# Altium schematic sheet 7V Buck.SchDoc
size B; SheetNumber: 2; SheetTotal: 9
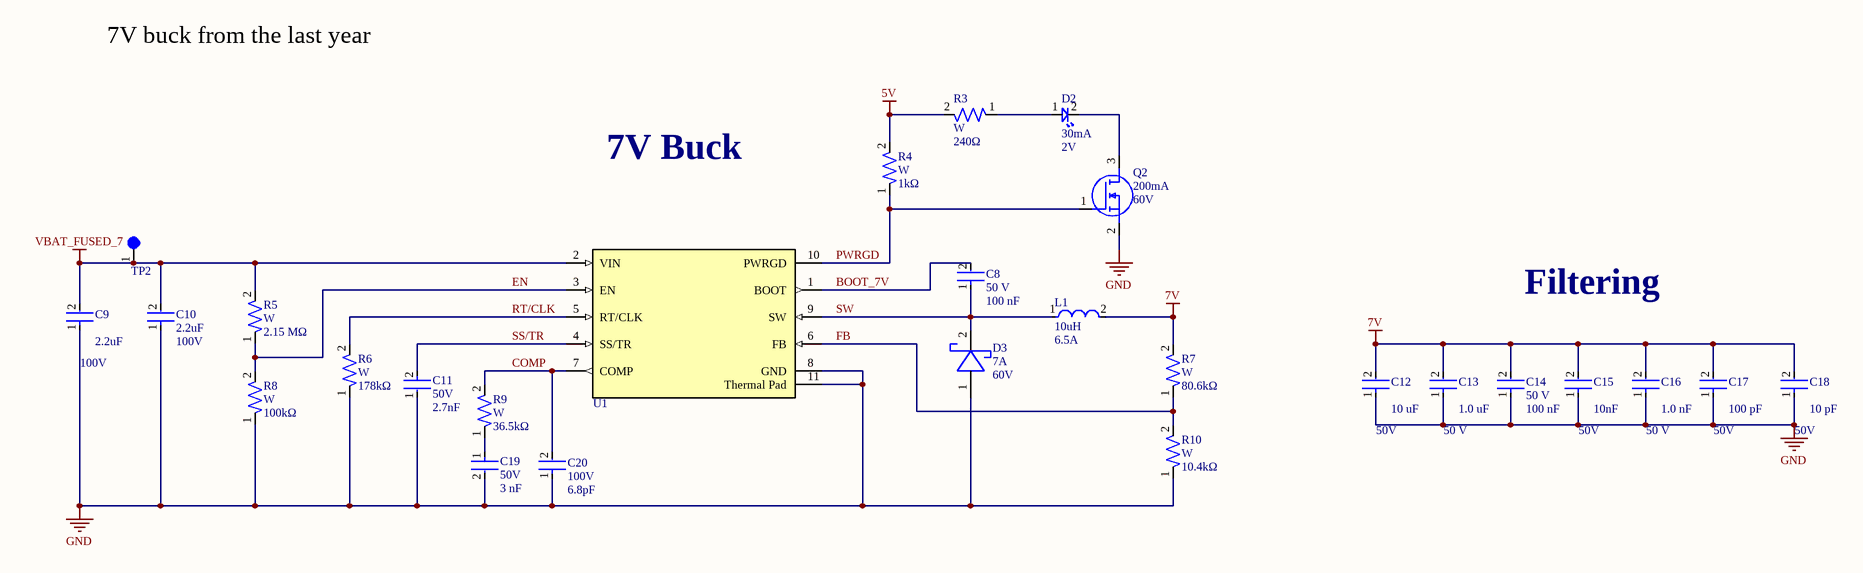
[diagram p0: 7V Buck.SchDoc]

## Parts
C8  Voltage Rating: 50 V  Capacitance: 100 nF  [CAP-0805]  (hidden comment: CC0805KRX7R9BB104)
C9  Capacitance: 2.2uF  Voltage: 100V  [CAP-1206]  (hidden comment: CC1206KKX7R0BB225)
C10  Capacitance: 2.2uF  Voltage: 100V  [CAP-1206]  (hidden comment: CC1206KKX7R0BB225)
C11  Voltage: 50V  Capacitance: 2.7nF  [CAP-0805]  (hidden comment: GRM2165C1H272JA01D)
C12  Capacitance: 10 uF  Voltage: 50V  [CAP-1210]  (hidden comment: CL32B106KBJNNNE)
C13  Capacitance: 1.0 uF  Voltage: 50 V  [CAP-0805]  (hidden comment: CC0805KKX7R9BB105)
C14  Voltage Rating: 50 V  Capacitance: 100 nF  [CAP-0805]  (hidden comment: CC0805KRX7R9BB104)
C15  Capacitance: 10nF  Voltage: 50V  [CAP-0805]  (hidden comment: GRM2195C1H103JA01D)
C16  Capacitance: 1.0 nF  Voltage: 50 V  [CAP-0402]  (hidden comment: CC0402KRX7R9BB102)
C17  Capacitance: 100 pF  Voltage: 50V  [CAP-0402]  (hidden comment: CC0402JRNPO9BN101)
C18  Capacitance: 10 pF  Voltage: 50V  [CAP-0402]  (hidden comment: CC0402JRNPO9BN100)
C19  Voltage: 50V  Capacitance: 3 nF  [CAP-0603]  (hidden comment: GRM1885C1H302JA01D)
C20  Voltage: 100V  Capacitance: 6.8pF  [CAP-0603]  (hidden comment: CC0603CRNPO0BN6R8)
D2  Forward Current: 30mA  Forward Voltage: 2V  [LED-0603]  (hidden comment: BL-HKC36G-AV-TRB)
D3  Forward Current: 7A  Reverse Voltage (DC): 60V  [DO-POWERDI5]  (hidden comment: PDS760-13)
L1  Inductance: 10uH  Current Rating: 6.5A  [IND-10UH-0001]  (hidden comment: BMRF001010401R0MD1)
Q2  Continuous Current: 200mA  Voltage: 60V  [IC-SOT23-3]  (hidden comment: T2N7002AK,LM)
R3  Wattage: W  Resistance: 240Ω  [RES-0805]  (hidden comment: ERJ-6GEYJ241V)
R4  Wattage: W  Resistance: 1kΩ  [RES-0805]  (hidden comment: CRCW08051K00FKEA)
R5  Wattage: W  Resistance: 2.15 MΩ  [RES-0805]  (hidden comment: CRCW08052M15FKEA)
R6  Wattage: W  Resistance: 178kΩ  [RES-0805]  (hidden comment: RC0805FR-07178KL)
R7  Wattage: W  Resistance: 80.6kΩ  [RES-0805]  (hidden comment: CRCW080580K6FKEA)
R8  Wattage: W  Resistance: 100kΩ  [RES-0805]  (hidden comment: ERA-6AEB104V)
R9  Wattage: W  Resistance: 36.5kΩ  [RES-0805]  (hidden comment: RC0805FR-0736K5L)
R10  Wattage: W  Resistance: 10.4kΩ  [RES-0805]  (hidden comment: RT0805BRD0710K4L)
TP2  5003  [TEST-POINT-0001]  (value not drawn)
U1  (no value)  [IC-10WSON]

## Nets
5V: R3.2 R4.2
7V: C12.2 C13.2 C14.2 C15.2 C16.2 C17.2 C18.2 L1.2 R7.2
GND: C9.1 C10.1 C11.1 C12.1 C13.1 C14.1 C15.1 C16.1 C17.1 C18.1 C19.2 C20.1 D3.1(CATHODE) Q2.2(S) R6.1 R8.1 R10.1 U1.8(GND) U1.11(Thermal_Pad)
VBAT_FUSED_7: C9.2 C10.2 R5.2 TP2.1 U1.2(VIN)
BOOT_7V: C8.2 U1.1(BOOT)
COMP: C20.2 R9.2 U1.7(COMP)
EN: R5.1 R8.2 U1.3(EN)
FB: R7.1 R10.2 U1.6(FB)
PWRGD: Q2.1(G) R4.1 U1.10(PWRGD)
RT/CLK: R6.2 U1.5(RT/CLK)
SS/TR: C11.2 U1.4(SS/TR)
SW: C8.1 D3.2(ANODE) L1.1 U1.9(SW)
NetC19_1: C19.1 R9.1
NetD2_1: D2.1 R3.1
NetD2_2: D2.2 Q2.3(D)

## Notes on the sheet
- 7V buck from the last year
- 7V Buck
- Filtering

## Library data of the parts
C8 C14 = CAP-0.1U-0002: CAP CER 0.1UF 50V X7R 0805; ComponentLink2Description: Datasheet; ComponentLink2URL: https://www.yageo.com/upload/media/product/productsearch/datasheet/mlcc/UPY-GPHC_X7R_6.3V-to-250V_24.pdf; Device Class: Ceramic; Size: 0805
C9 C10 = CAP-2.2U-0001: CAP CER 2.2UF 100V X7R 1206; Device Class: Ceramic; Size: 1206; ComponentLink1Description: Datasheet; ComponentLink1URL: https://www.yageo.com/upload/media/product/productsearch/datasheet/mlcc/UPY-GPHC_X7R_6.3V-to-250V_24.pdf
C11 = CAP-2.7N-0001: CAP CER 2700PF 50V C0G/NP0 0805; ComponentLink1Description: Datasheet; ComponentLink1URL: https://search.murata.co.jp/Ceramy/image/img/A01X/G101/ENG/GRM2165C1H272JA01-01.pdf; Device Class: Ceramic; Size: 0805
C12 = CAP-10U-0002: CAP CER 10UF 50V X7R 1210; Device Class: Ceramic; Size: 1210; ComponentLink1Description: Datasheet; ComponentLink1URL: https://mm.digikey.com/Volume0/opasdata/d220001/medias/docus/41/CL32B106KBJNNNE_Spec.pdf
C13 = CAP-1U-0001: CAP CER 1UF 50V X7R 0805; ComponentLink2URL: https://www.yageo.com/upload/media/product/productsearch/datasheet/mlcc/UPY-GPHC_X7R_6.3V-to-250V_24.pdf; ComponentLink2Description: Datasheet; Device Class: Ceramic; Size: 0805
C15 = CAP-10N-0001: CAP CER 10000PF 50V C0G/NP0 0805; Device Class: Ceramic; Size: 0805; ComponentLink1Description: Datasheet; ComponentLink1URL: https://search.murata.co.jp/Ceramy/image/img/A01X/G101/ENG/GRM2195C1H103JA01-01.pdf
C16 = CAP-1N-0001: CAP CER 1000PF 50V X7R 0402; ComponentLink2Description: Datasheet; ComponentLink2URL: http://www.yageo.com/documents/recent/UPY-GP_NP0_16V-to-50V_16.pdf; Device Class: Ceramic; Size: 0402
C17 = CAP-100P-0001: CAP CER 100PF 50V C0G/NPO 0402; Device Class: Ceramic; Size: 0402; ComponentLink1Description: Datasheet; ComponentLink1URL: https://www.yageo.com/upload/media/product/productsearch/datasheet/mlcc/UPY-GP_NP0_16V-to-50V_18.pdf
C18 = CAP-10P-0001: CAP CER 10PF 50V C0G/NPO 0402; Device Class: Ceramic; Size: 0402; ComponentLink1Description: Datasheet; ComponentLink1URL: https://www.yageo.com/upload/media/product/productsearch/datasheet/mlcc/UPY-GP_NP0_16V-to-50V_18.pdf
C19 = CAP-3N-0001: 3000 pF ±5% 50V Ceramic Capacitor C0G, NP0 0603 (1608 Metric); Device Class: Ceramic; Size: 1210; ComponentLink1Description: Datasheet; ComponentLink1URL: https://mm.digikey.com/Volume0/opasdata/d220001/medias/docus/41/CL32B106KBJNNNE_Spec.pdf
C20 = CAP-6.8P-0001: CAP CER 6.8PF 100V C0G/NPO 0603; Device Class: Ceramic; ComponentLink1Description: Datasheet; ComponentLink1URL: https://www.yageo.com/upload/media/product/productsearch/datasheet/mlcc/UPY-GPHC_X7R_6.3V-to-250V_24.pdf; Size: 0603
D2 = LED-0001: LED YELLOW CLEAR 0603 SMD; ComponentLink1Description: Datasheet; ComponentLink1URL: https://www.americanbrightled.com/pdffiles/led-components/smt/BL-HKC36G-AV-TRB.pdf
D3 = DIO-SCHOTTKY-0001: DIODE SCHOTTKY 60V 7A POWERDI5; ComponentLink1Description: Datasheet; ComponentLink1URL: https://www.diodes.com/assets/Datasheets/PDS760.pdf
L1 = IND-10U-0001: FIXED IND 10UH 6.5A 30 MOHM SMD; ComponentLink1Description: Datasheet; ComponentLink1URL: https://productfinder.pulseelectronics.com/api/open/part-attachments/datasheet/BMRF001010401R0MD1
Q2 = NMOS-200MA-0001: MOSFET N-CH 60V 200MA SOT23; ComponentLink1Description: Datasheet; ComponentLink1URL: https://toshiba.semicon-storage.com/info/T2N7002AK_datasheet_en_20150401.pdf?did=29712&prodName=T2N7002AK
R3-R10 = RES 0805
TP2 = TEST-POINT-0001: Oranange PC Test Point, Miniature Phoisphor Bronze Silver Plating Through Hole Mounting Type
U1 = IC-BUCK-0001: IC REG BUCK ADJ 5A 10WSON; ComponentLink1Description: Datasheet; ComponentLink1URL: https://www.ti.com/general/docs/suppproductinfo.tsp?distId=10&gotoUrl=https%3A%2F%2Fwww.ti.com%2Flit%2Fgpn%2Ftps54561